# EasyEDA Pro project ESP32S3_DMX_RDM_2026-06-09.epro, board PCB4_1
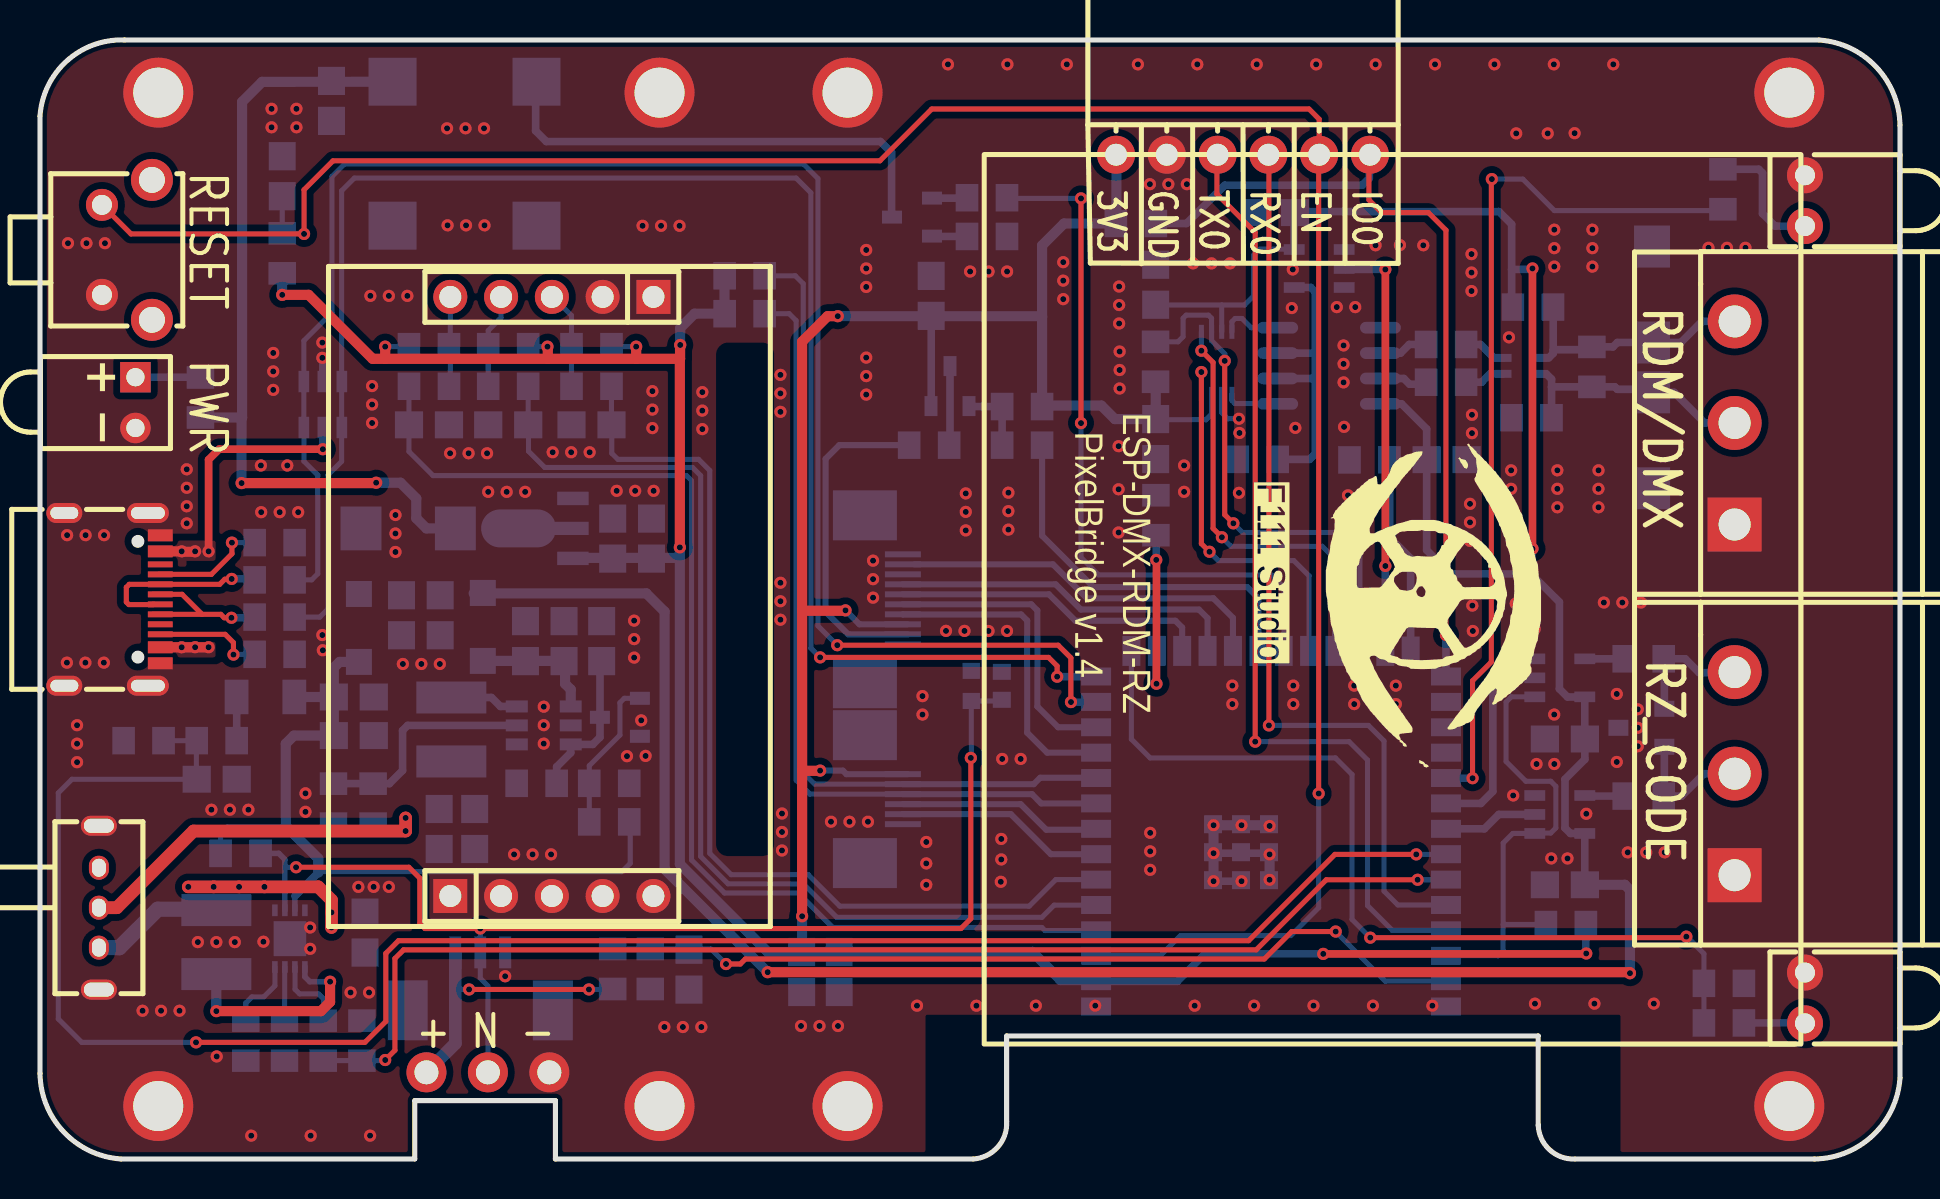
[diagram p11: board, top side]
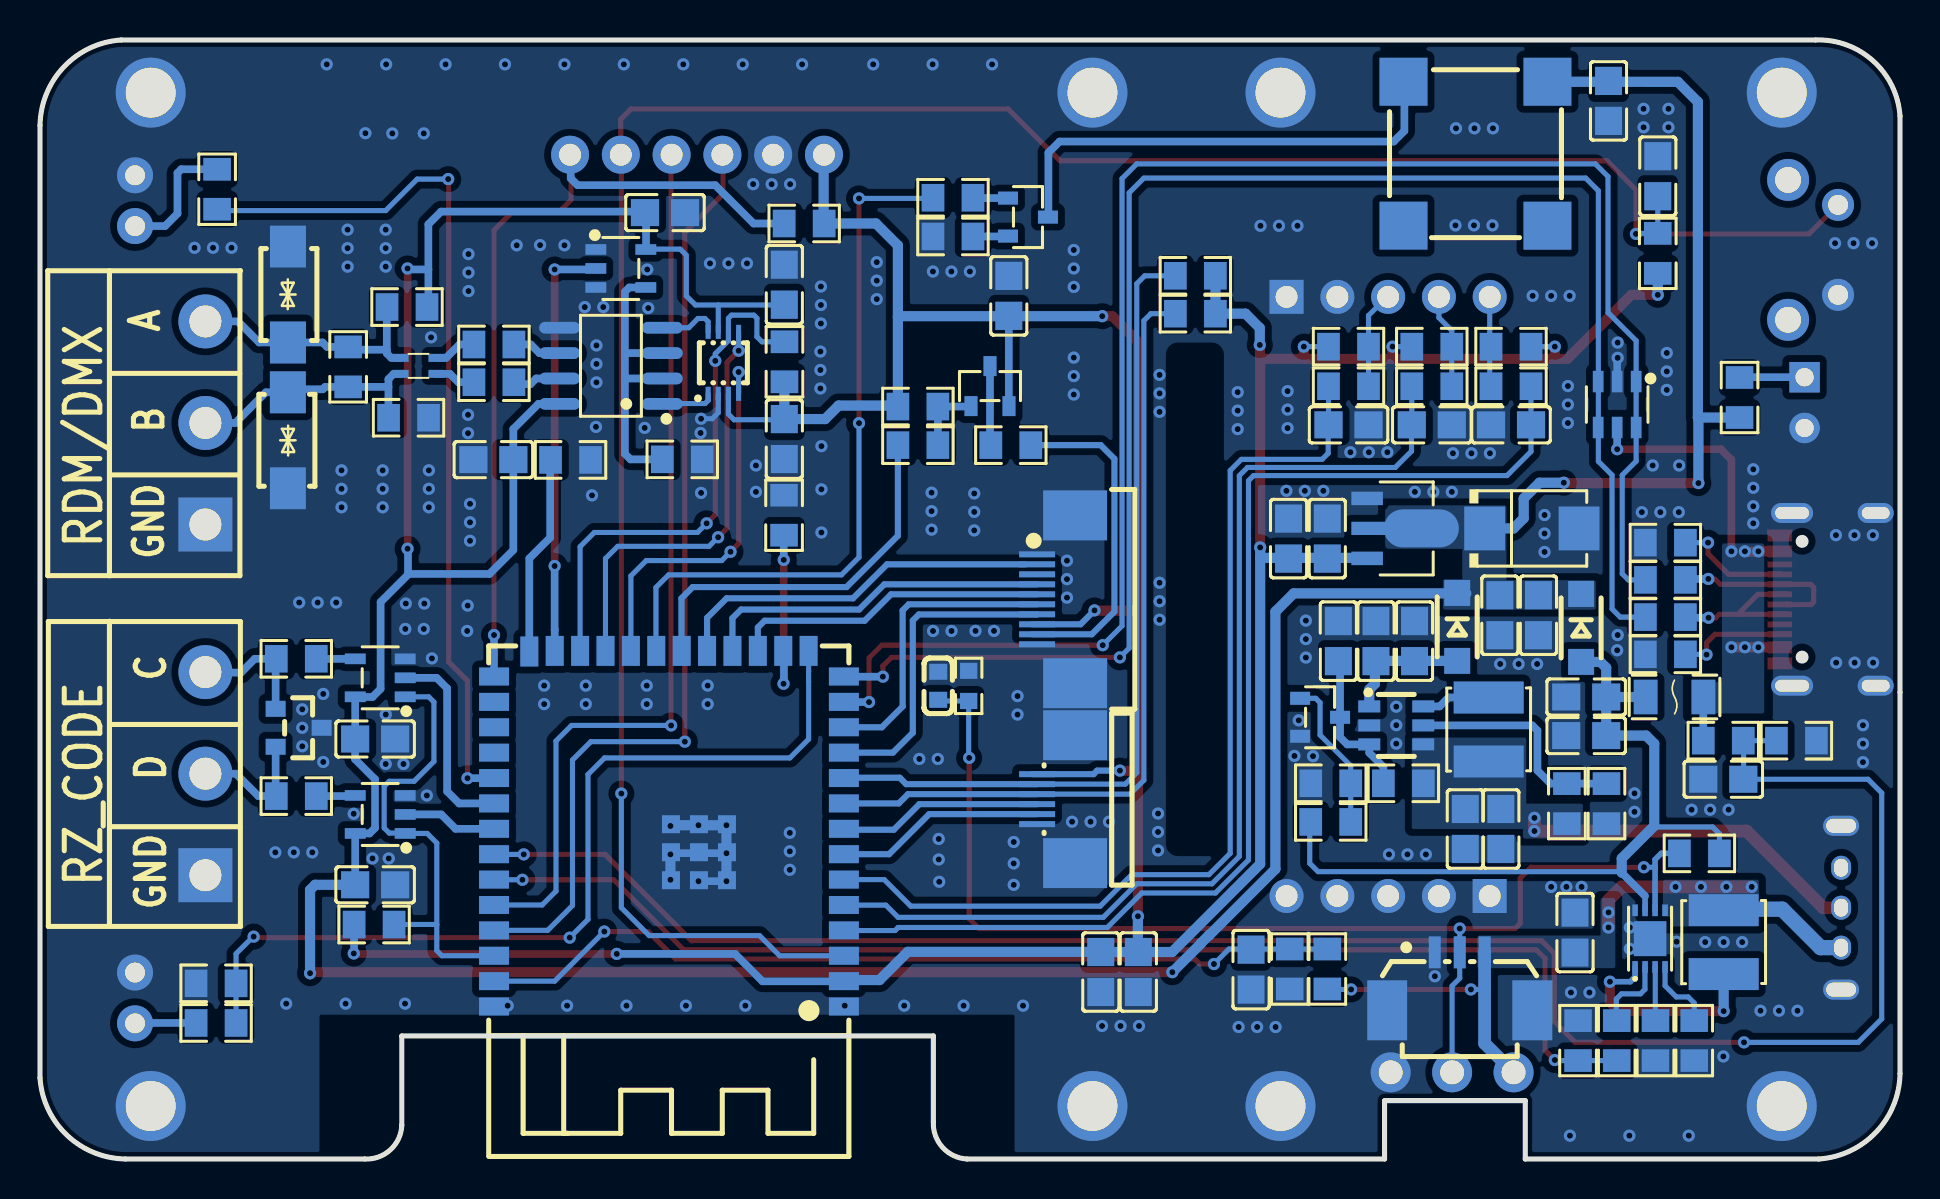
[diagram p12: board, bottom side, seen from below]

Outline 93.03 x 55.98 mm; copper layers: Top Layer, Bottom Layer. Coordinates in mm from the lower left corner of the outline.
Outline path: 0,52.17 0,23.35 0,4.27 arc(1.2,1.34) 4.06,0 18.74,0 18.74,2.92 25.78,2.92 25.78,0 46.66,0 arc(47.89,0.59) 48.35,1.87 48.35,6.16 74.94,6.16 74.94,1.69 arc(75.51,0.46) 76.78,0 88.76,0 arc(91.69,1.2) 93.03,4.06 93.03,51.71 arc(91.84,54.64) 88.97,55.98 4.22,55.98 arc(1.34,54.93) 0,52.17
Stack: Top Layer 0.035mm / Dielectric1 1.51mm FR4 er 4.5 / Bottom Layer 0.035mm

## Design rules (mm)
spacing copperThickness1oz (default): track to track 0.102, other pairs 0.152 to 0.3
spacing copperThickness2oz: track to track 0.203, other pairs 0.152 to 0.3
track width copperThickness1oz (default): min 0.127, default 0.254, max 2.54
track width copperThickness2oz: min 0.203, default 0.254, max 2.54
differential pair differentialPair (default): width min 0.127, default 0.254, max 2.54; gap min 0.152, default 0.152
net GND uses copperRegion1_copperThickness1oz
net VBAT uses copperRegion1_copperThickness2oz, copperThickness2oz
net +5V uses copperRegion1_copperThickness1oz
net VBUS uses copperRegion1_copperThickness1oz
net $2N70 uses copperRegion1_copperThickness1oz

## Placement (name value [footprint] x y rotation side)
C1  100nF  [C0805]  61.77 47.35 0 bottom
C2  100nF  [C0805]  76.27 21.01 0 bottom
C3  100nF  [C0805]  76.27 13.72 0 bottom
C4  100nF  [C0805]  55.8 43.74 90 bottom
C5  100nF  [C0805]  55.8 36.02 90 bottom
C6  100nF  [C0805]  70.36 34.99 180 bottom
C7  10uF  [C0805]  38.1 9.36 90 bottom
C8  100nF  [C0805]  39.98 9.36 90 bottom
C9  100nF  [C0805]  12.12 49.17 270 bottom
C10  100nF  [C0805]  32.46 9.47 90 bottom
C11  22uF  [C0805]  18.08 27.2 90 bottom
C12  100nF  [C0805]  20.02 27.2 90 bottom
C13  22uF  [C0805]  30.58 31.04 270 bottom
C14  100nF  [C0805]  28.65 31.04 270 bottom
C15  22uF  [C0805]  44.58 43.18 270 bottom
C16  100nF  [C0805]  28.09 25.91 270 bottom
C17  10uF  [C0805]  19.96 16.51 270 bottom
C18  22uF  [C0805]  21.74 16.51 270 bottom
C20  22uF  [C0805]  24.28 25.91 90 bottom
C21  22uF  [C0805]  26.21 25.91 90 bottom
C22  100nF  [C0805]  14.58 52.93 90 bottom
C23  10uF  [C0805]  15.7 23.11 0 bottom
C24  100nF  [C0805]  15.7 21.18 180 bottom
C25  10nF  [C0805]  19.46 36.73 180 bottom
C26  10nF  [C0805]  23.42 36.73 0 bottom
C27  10nF  [C0805]  27.58 36.73 0 bottom
C28  10uF  [C0805]  16.26 11.33 90 bottom
C29  100nF  [C0805]  8.84 19 180 bottom
C30  100nF  [C0603]  48.11 23.67 270 bottom
CN1  WJ2EDGRC-5.08-03P-14-00A  [CONN-TH_3P-P5.08_WJ2EDGRC-5.08-3P]  84.76 36.82 90 top
CN2  WJ2EDGRC-5.08-03P-14-00A  [CONN-TH_3P-P5.08_WJ2EDGRC-5.08-3P]  84.76 19.28 90 top
CN3  HCZZ0001-3  [CONN-SMD_3P-P1.25_HCZZ0001-3]  22.02 8.89 180 bottom
D1  PESD5V0S2BT,215  [SOT-23_L2.9-W1.3-P1.90-LS2.4-BR]  80.1 21.57 0 bottom
D2  PMEG2020EH,115  [SOD-123FL_L2.6-W1.6-LS3.4-R-FD]  15.95 26.57 90 bottom
D3  USBLC6-2SC6  [SOT-23-6_L2.9-W1.6-P0.95-LS2.8-BL]  14.15 37.74 0 bottom
D4  PMEG2020EH,115  [SOD-123FL_L2.6-W1.6-LS3.4-R-FD]  22.15 26.62 90 bottom
F1  1206L050/36NR  [F1206]  11.28 23.11 180 bottom
FPC1  05B20L06P  [FPC-SMD_6P-P0.50_05B20L06P]  42.21 18 270 bottom
L1  ACM2012-900-2P-T002  [IND-SMD_4P-L2.0-W1.2-TL]  74.1 39.68 0 bottom
L2  2.2uH  [IND-SMD_L4.0-W4.0]  20.57 21.49 270 bottom
L3  2.2uH  [IND-SMD_L4.0-W4.0]  8.82 10.85 270 bottom
LED1  MHK1375CRBTD  [LED-TH_MHK1375CRBTD]  4.77 37.84 270 top
LED2  MHK1375CGBTD  [LED-TH_MHK1375CGBTD]  88.28 8.06 90 top
LED3  MHK1375CGBTD  [LED-TH_MHK1375CGBTD]  88.28 47.94 90 top
NOREF  -  [Pad_e189]  5.92 53.35 0 top
NOREF#2  -  [Pad_e1365]  30.99 2.65 0 top
NOREF#3  -  [Pad_e192]  87.5 2.65 0 top
NOREF#4  -  [Pad_e193]  87.5 53.35 0 top
NOREF#5  -  [Pad_e188]  5.92 2.65 0 top
NOREF#6  -  [Pad_e191]  40.39 53.35 0 top
NOREF#7  -  [Pad_e1382]  30.99 53.35 0 top
NOREF#8  -  [Pad_e190]  40.39 2.65 0 top
Q1  2N7002  [SOT-23-3_L2.9-W1.3-P1.90-LS2.4-BR]  29.01 22.1 0 bottom
Q2  AO3401A  [SOT-23-3_L2.9-W1.3-P1.90-LS2.4-BR]  45.52 38.67 270 bottom
Q3  S8050  [SOT-23-3_L2.9-W1.3-P1.90-LS2.4-BR]  43.62 47.12 0 bottom
R1  33R  [R0805]  80.22 18.16 180 bottom
R2  10kΩ  [R0805]  55.8 39.88 270 bottom
R3  10kΩ  [R0805]  60.91 35 180 bottom
R4  1kΩ  [R0805]  74.6 37.08 180 bottom
R5  10kΩ  [R0805]  76.32 11.73 0 bottom
R6  0Ω  [R0805]  70.33 38.86 180 bottom
R7  120R  [R0805]  77.62 39.63 270 bottom
R8  33R  [R0805]  80.22 25.02 180 bottom
R9  0Ω  [R0805]  70.33 40.75 180 bottom
R10  1kΩ  [R0805]  74.68 42.62 0 bottom
R11  10kΩ  [R0805]  12.12 45.31 270 bottom
R12  4.7kΩ  [R0805]  8.03 38.09 270 bottom
R13  5.1kΩ  [R0805]  11.73 30.84 0 bottom
R17  10kΩ  [R0805]  54.81 46.8 180 bottom
R18  150kΩ  [R0805]  28.64 9.51 270 bottom
R19  10kΩ  [R0805]  55.82 32.21 270 bottom
R20  10kΩ  [R0805]  66.5 34.97 0 bottom
R21  100kΩ  [R0805]  30.52 9.51 90 bottom
R22  1kΩ  [R0805]  84.23 6.81 180 bottom
R23  1kΩ  [R0805]  84.18 48.51 270 bottom
R24  150kΩ  [R0805]  5.18 20.93 0 bottom
R25  100kΩ  [R0805]  49.12 37.64 0 bottom
R26  100kΩ  [R0805]  28.47 18.8 0 bottom
R27  10kΩ  [R0805]  28.47 16.87 180 bottom
R28  100Ω  [R0805]  49.12 35.71 180 bottom
R29  100kΩ  [R0805]  24.84 18.8 0 bottom
R30  33Ω  [R0805]  44.48 35.71 0 bottom
R31  150kΩ  [R0805]  16.66 17.78 270 bottom
R32  36kΩ  [R0805]  14.68 17.78 90 bottom
R33  4.7kΩ  [R0805]  35.25 44.19 180 bottom
R34  4.7kΩ  [R0805]  35.25 42.29 180 bottom
R35  33kΩ  [R0805]  16.1 5.92 90 bottom
R36  4.7kΩ  [R0805]  19.46 40.64 180 bottom
R37  4.7kΩ  [R0805]  23.42 40.64 0 bottom
R38  4.7kΩ  [R0805]  27.58 40.64 0 bottom
R39  22kΩ  [R0805]  14.17 5.92 270 bottom
R40  100Ω  [R0805]  23.42 38.66 180 bottom
R41  1kΩ  [R0805]  47.37 48.09 180 bottom
R42  100Ω  [R0805]  27.58 38.66 0 bottom
R43  100Ω  [R0805]  19.46 38.66 0 bottom
R44  100Ω  [R0805]  47.37 46.15 180 bottom
R45  0Ω  [R0805]  12.23 5.92 270 bottom
R46  100kΩ  [R0805]  8.84 20.93 0 bottom
R47  10kΩ  [R0805]  10.29 5.92 270 bottom
R48  15kΩ  [R0805]  10.03 15.29 0 bottom
R49  10kΩ  [R0805]  84.23 8.79 180 bottom
R50  0Ω  [R0805]  11.73 28.97 0 bottom
R51  0Ω  [R0805]  11.73 27.11 180 bottom
R52  5.1kΩ  [R0805]  11.73 25.25 0 bottom
R53  SDNT1608X103F3950FTF  [R0603]  46.58 23.67 270 bottom
SW1  KH-6X6X6H-ZJ  [SW-TH_KH-6X6X6H-ZJ-A]  4.35 45.48 270 top
SW2  SK-12D02-G030  [SW-TH_SK-12D02VG3]  2.95 12.57 270 top
TVS1  SMBJ5.0A  [SMB_L4.6-W3.6-LS5.3-RD]  18.42 31.55 180 bottom
U1  SN74AHCT1G125DBVR(UMW)  [SOT-23-5_L3.0-W1.5-P0.95-LS2.8-BL]  63.98 44.55 270 bottom
U2  SN74AHCT1G125DBVR(UMW)  [SOT-23-5_L3.0-W1.5-P0.95-LS2.8-BL]  76.02 17.24 90 bottom
U3  SMAJ12CA  [SMA_L4.3-W2.7-LS5.1-BI]  80.63 35.95 90 bottom
U4  THVD1450DR  [SOIC-8_L4.9-W3.9-P1.27-LS6.0-BL]  64.48 39.68 90 bottom
U5  SN74AHCT1G125DBVR(UMW)  [SOT-23-5_L3.0-W1.5-P0.95-LS2.8-BL]  76.02 24.07 90 bottom
U6  TXS0102DCUR  [VSON8_L2.0-W2.3-P0.50-LS3.1-BL]  58.85 39.83 180 bottom
U7  SMAJ12CA  [SMA_L4.3-W2.7-LS5.1-BI]  80.63 43.25 270 bottom
U8  2.4GHz  [WIRELM-SMD_ESP32-S3-WROOM-1]  61.57 16.52 0 bottom
U9  DS1024-1x6R2  [HDR-TH_6P-P2.54-H-F-W10.0-N]  60.17 50.24 180 top
U10  AP7365-33YRG-13  [SOT-89-3_L4.5-W2.5-P1.50-LS4.2-BR]  25.3 31.55 0 bottom
U11  HC-FPC-0.5-10P-CSH20  [FPC-SMD_10P-P0.50_HC-FPC-0.5-10P-CSH20]  42.21 28 90 bottom
U12  ETA1039S2G  [SOT-23-6_L2.9-W1.6-P0.95-LS2.8-BR]  25.2 21.69 0 bottom
U13  2541WV-05P  [HDR-TH_5P-P2.54-V-M]  25.6 13.16 0 top
U14  2541WV-05P  [HDR-TH_5P-P2.54-V-M]  25.6 43.13 180 top
U15  2.731kHz  [BUZ-SMD_4P-L8.5-W8.5-P8.50-TL-A]  21.23 50.29 270 bottom
U16  SGM41524YTDC8G/TR  [DFN-8_L3.0-W2.0-P0.50-TL-EP-1]  12.5 11.02 90 bottom
U17  GT-USB-7010ASV  [USB-C-SMD_G-SWITCH_GT-USB-7010ASV]  3.62 28 270 top
U19  -  [电池焊盘]  25.48 4.34 0 top
U20  -  [电池焊盘]  19.33 4.34 0 top
U21  -  [电池焊盘]  22.4 4.34 0 top

## Footprints (pads in the part's own frame, mm; a bottom-side part is the same pattern mirrored in y, then rotated)
BUZ-SMD_4P-L8.5-W8.5-P8.50-TL-A
  rect 2.4x2.4 smd: 1(-3.6,3.6) 2(-3.6,-3.6) 3(3.599,-3.599) 4(3.6,3.6)
C0603
  rect 0.8x0.9 smd: 1(-0.7,0) 2(0.7,0)
C0805
  rect 1.41x1.35 smd: 1(-1,0) 2(1,0)
CONN-SMD_3P-P1.25_HCZZ0001-3
  rect 0.6x1.6 smd: 1(-1.25,1.45) 2(0,1.45) 3(1.25,1.45)
  rect 2x3 smd: 4(3.63,-1.45) 5(-3.63,-1.45)
CONN-TH_3P-P5.08_WJ2EDGRC-5.08-3P
  rect 2.7x2.7 hole 1.6: 1(-5.08,0)
  round 2.7 hole 1.6: 2(0,0) 3(5.08,0)
DFN-8_L3.0-W2.0-P0.50-TL-EP-1
  rect 0.585x0.28 smd: 1(-1.417,0.75) 2(-1.417,0.25) 3(-1.417,-0.25) 4(-1.417,-0.75) 5(1.417,-0.75) 6(1.417,-0.25) 7(1.417,0.25) 8(1.417,0.75)
  rect 1.75x1.63 smd: 9(0,0)
F1206
  rect 1.19x1.728 smd: 1(-1.445,0) 2(1.445,0)
FPC-SMD_6P-P0.50_05B20L06P
  rect 0.3x1.8 smd: 1(-1.25,-0.95) 2(-0.75,-0.95) 3(-0.25,-0.95) 4(0.25,-0.95) 5(0.75,-0.95) 6(1.25,-0.95)
  rect 2.5x3.2 smd: 7(-3.2,0.95) 8(3.2,0.95)
FPC-SMD_10P-P0.50_HC-FPC-0.5-10P-CSH20
  rect 0.3x1.8 smd: 1(2.25,0.95) 2(1.75,0.95) 3(1.25,0.95) 4(0.75,0.95) 5(0.25,0.95) 6(-0.25,0.95) 7(-0.75,0.95) 8(-1.25,0.95) 9(-1.75,0.95) 10(-2.25,0.95)
  rect 2.5x3.2 smd: 11(-4.2,-0.95) 12(4.2,-0.95)
HDR-TH_5P-P2.54-V-M
  rect 1.7x1.7 hole 1.1: 1(-5.08,0)
  round 1.7 hole 1.1: 2(-2.54,0) 3(0,0) 4(2.54,0) 5(5.08,0)
HDR-TH_6P-P2.54-H-F-W10.0-N
  round 1.9 hole 1.1: 1(-6.35,0) 2(-3.81,0) 3(-1.27,0) 4(1.27,0) 5(3.81,0) 6(6.35,0)
IND-SMD_4P-L2.0-W1.2-TL
  rect 0.8x0.4 smd: 1(-0.901,0.399) 2(-0.899,-0.4) 3(0.9,-0.401) 4(0.901,0.401)
IND-SMD_L4.0-W4.0
  rect 1.6x3.5 smd: 1(-1.6,0) 2(1.6,0)
LED-TH_MHK1375CGBTD
  round 1.8 hole 1: 1(-1.27,0) 2(1.27,0)
LED-TH_MHK1375CRBTD
  rect 1.524x1.524 hole 0.914: 1(-1.27,0)
  round 1.524 hole 0.914: 2(1.27,0)
Pad_e188
  round 3.5 hole 2.5: 1(0,0)
Pad_e189
  round 3.5 hole 2.5: 1(0,0)
Pad_e190
  round 3.5 hole 2.5: 1(0,0)
Pad_e191
  round 3.5 hole 2.5: 1(0,0)
Pad_e192
  round 3.5 hole 2.5: 1(0,0)
Pad_e193
  round 3.5 hole 2.5: 1(0,0)
Pad_e1365
  round 3.5 hole 2.5: 1(0,0)
Pad_e1382
  round 3.5 hole 2.5: 1(0,0)
R0603
  rect 0.806x0.864 smd: 1(-0.753,0) 2(0.753,0)
R0805
  rect 1.133x1.377 smd: 1(-1,0) 2(1,0)
SMA_L4.3-W2.7-LS5.1-BI
  rect 2.1x1.8 smd: 1(-2.4,0) 2(2.4,0)
SMB_L4.6-W3.6-LS5.3-RD
  rect 2.047x2.192 smd: 1(-2.361,0) 2(2.361,0)
SOD-123FL_L2.6-W1.6-LS3.4-R-FD
  rect 1.3x1.3 smd: 1(1.7,0) 2(-1.7,0)
SOIC-8_L4.9-W3.9-P1.27-LS6.0-BL
  oval 0.588x2.045 smd: 1(-1.905,-2.57) 2(-0.635,-2.57) 3(0.635,-2.57) 4(1.905,-2.57) 5(1.905,2.57) 6(0.635,2.57) 7(-0.635,2.57) 8(-1.905,2.57)
SOT-23-3_L2.9-W1.3-P1.90-LS2.4-BR
  rect 1x0.65 smd: 1(1,-0.95) 2(1,0.95) 3(-1,0)
SOT-23-5_L3.0-W1.5-P0.95-LS2.8-BL
  rect 0.532x1.045 smd: 1(-0.95,-1.25) 2(0,-1.25) 3(0.95,-1.25) 4(0.95,1.25) 5(-0.95,1.25)
SOT-23-6_L2.9-W1.6-P0.95-LS2.8-BL
  rect 0.532x1.072 smd: 1(-0.95,-1.149) 2(0,-1.149) 3(0.95,-1.149) 4(0.95,1.149) 5(0,1.149) 6(-0.95,1.149)
SOT-23-6_L2.9-W1.6-P0.95-LS2.8-BR
  rect 1.1x0.6 smd: 1(1.35,-0.95) 2(1.35,0) 3(1.35,0.95) 4(-1.35,0.95) 5(-1.35,0) 6(-1.35,-0.95)
SOT-23_L2.9-W1.3-P1.90-LS2.4-BR
  rect 1x0.8 smd: 1(1.15,-0.95) 2(1.15,0.95) 3(-1.15,0)
SOT-89-3_L4.5-W2.5-P1.50-LS4.2-BR
  rect 1.575x0.672 smd: 1(1.356,-1.5) 3(1.356,1.5)
  custom 5.377x1.9 smd: 2(-1.356,0)
SW-TH_KH-6X6X6H-ZJ-A
  round 1.6 hole 1: 1(-2.25,-1.25) 2(2.25,-1.25)
  round 2.1 hole 1.3: 3(-3.5,1.25) 4(3.5,1.25)
SW-TH_SK-12D02VG3
  oval 1.2x1 hole 0.9x0.7: 1(-1.998,0) 2(0.001,0) 3(1.999,0)
  oval 1x1.8 hole 0.7x1.5: 4(4.099,0) 5(-4.099,0)
USB-C-SMD_G-SWITCH_GT-USB-7010ASV
  oval 1x2.1 hole 0.6x1.7: 1(-4.32,1.78) 2(4.32,1.78)
  oval 1x1.8 hole 0.6x1.4: 3(4.32,-2.4) 4(-4.32,-2.4)
  rect 0.6x1.24 smd: A1B12(-3.2,2.4) A4B9(-2.4,2.4) B1A12(3.2,2.4) B4A9(2.4,2.4)
  rect 0.3x1.24 smd: A5(-1.25,2.4) A6(-0.25,2.4) A7(0.25,2.4) A8(1.25,2.4) B5(1.75,2.4) B6(0.75,2.4) B7(-0.75,2.4) B8(-1.75,2.4)
VSON8_L2.0-W2.3-P0.50-LS3.1-BL
  rect 0.25x0.7 smd: 1(-0.762,-1.55) 2(-0.254,-1.55) 3(0.254,-1.55) 4(0.762,-1.55) 5(0.762,1.55) 6(0.254,1.55) 7(-0.254,1.55) 8(-0.762,1.55)
WIRELM-SMD_ESP32-S3-WROOM-1
  rect 1.5x0.9 smd: 1(-8.75,8.895) 2(-8.75,7.625) 3(-8.75,6.355) 4(-8.75,5.085) 5(-8.75,3.815) 6(-8.75,2.545) 7(-8.75,1.275) 8(-8.75,0.005) 9(-8.75,-1.265) 10(-8.75,-2.535) 11(-8.75,-3.805) 12(-8.75,-5.075) 13(-8.75,-6.345) 14(-8.75,-7.615) 27(8.75,-7.615) 28(8.75,-6.345) 29(8.75,-5.075) 30(8.75,-3.805) 31(8.75,-2.535) 32(8.75,-1.265) 33(8.75,0.005) 34(8.75,1.275) 35(8.75,2.545) 36(8.75,3.815) 37(8.75,5.085) 38(8.75,6.355) 39(8.75,7.625) 40(8.75,8.895)
  rect 0.9x1.5 smd: 15(-6.985,-8.895) 16(-5.715,-8.895) 17(-4.445,-8.895) 18(-3.175,-8.895) 19(-1.905,-8.895) 20(-0.635,-8.895) 21(0.635,-8.895) 22(1.905,-8.895) 23(3.175,-8.895) 24(4.445,-8.895) 25(5.715,-8.895) 26(6.985,-8.865)
  rect 0.9x0.9 smd: 41(-2.9,-0.225) 41(-2.9,1.175) 41(-2.9,2.575) 41(-1.5,-0.225) 41(-1.5,1.175) 41(-1.5,2.575) 41(-0.1,-0.225) 41(-0.1,1.175) 41(-0.1,2.575)
电池焊盘
  round 2 hole 1.2: 1(0,0)

## Nets
+3.3V: C5.2 C7.2 C8.2 C13.2 C14.2 C15.2 FPC1.1 Q2.2 R2.2 R5.2 R11.2 R17.2 R25.2 R33.2 R34.2 R36.2 R37.2 R38.2 U6.3 U8.2 U9.6 U10.3 U11.8
+5V: C1.2 C2.2 C3.2 C4.1 C6.2 C11.2 C12.2 C22.2 D2.1 D4.1 R10.1 R12.2 TVS1.1 U1.5 U2.5 U4.8 U5.5 U6.7 U10.2 U15.1
GND: C1.1 C2.1 C3.1 C4.2 C5.1 C6.1 C7.1 C8.1 C9.1 C10.1 C11.1 C12.1 C13.1 C14.1 C15.1 C16.1 C17.2 C18.2 C20.2 C21.2 C22.1 C23.2 C24.1 C25.1 C26.1 C27.1 C28.2 C29.1 C30.1 CN1.1 CN2.1 CN3.1 CN3.4 CN3.5 D1.3 D3.2 FPC1.6 FPC1.7 FPC1.8 LED1.2 LED2.2 LED3.2 NOREF.1 NOREF#2.1 NOREF#3.1 NOREF#4.1 NOREF#5.1 NOREF#6.1 NOREF#7.1 NOREF#8.1 Q1.2 R3.2 R4.2 R13.2 R19.1 R20.1 R21.1 R24.1 R26.2 R32.1 R35.2 R44.1 R45.2 R47.2 R49.1 R52.2 R53.1 SW1.2 SW2.4 SW2.5 TVS1.2 U1.1 U1.3 U2.3 U3.1 U4.5 U5.3 U6.2 U7.1 U8.1 U8.40 U8.41 U9.5 U10.1 U11.1 U11.10 U11.11 U11.12 U12.2 U13.1 U13.2 U13.3 U13.4 U13.5 U14.1 U14.2 U16.8 U16.9 U17.1 U17.2 U17.3 U17.4 U17.A1B12 U17.B1A12 U19.1
VBAT: C28.1 CN3.3 L3.1 R18.2 SW2.3 U16.5 U20.1
VBUS: D3.5 F1.2 R46.2 U17.A4B9 U17.B4A9
A: R37.1 R40.2 U14.4
B: R36.1 R43.2 U14.5
BAT_ADC: C10.2 R18.1 R21.2 U8.39
BEEP: R41.1 U8.21
CHARGING: R35.1 R39.2 U8.35
CTP_INT: FPC1.4 U8.8
CTP_RST: FPC1.5 U8.7
CTP_SCL: FPC1.3 R34.1 U8.9
CTP_SDA: FPC1.2 R33.1 U8.10
DMX_EN: U1.2 U8.25
DMX_OE: R2.1 U6.6 U8.24
DMX_RX: U6.4 U8.22
DMX_TX: U6.5 U8.23
DN: R50.1 U17.A7 U17.B7
DP: R51.2 U17.A6 U17.B6
EN: C9.2 R11.1 SW1.1 U8.3 U9.2
ENCODER_A: C26.2 R40.1 U8.5
ENCODER_B: C25.2 R43.1 U8.4
ENCODER_KEY: C27.2 R42.2 U8.6
IO0: R17.1 U8.27 U9.1
KEY: R38.1 R42.1 U14.3
LCD_A: R30.1 U11.9
LCD_BL: R28.1 U8.20
LCD_CS: U8.17 U11.5
LCD_RS: U8.11 U11.7
LCD_RST: U8.12 U11.6
LCD_SCL: U8.18 U11.4
LCD_SDA: U8.19 U11.2
LED2: R22.2 R49.2 U8.15
LED3: R23.2 U8.31
RXD0: U8.36 U9.3
RZ_CLK: U5.2 U8.32
RZ_DATA: U2.2 U8.33
RZ_OE: R5.1 U2.1 U5.1 U8.38
TXD0: U8.37 U9.4
USB_DET: C29.2 R24.2 R46.1 U8.34
USB_DN: D3.1 D3.6 R50.2 U8.13
USB_DP: D3.3 D3.4 R51.1 U8.14
VCHAR: C23.1 C24.2 D2.2 F1.1 R27.1 R48.1 U16.7
$1N61: CN1.3 L1.3 R7.1 R10.2 U7.2
$1N69: R3.1 U1.4 U4.2 U4.3
$1N71: CN1.2 L1.4 R4.1 R7.2 U3.2
$1N81: R1.2 U2.4
$1N82: R8.2 U5.4
$1N83: CN2.2 D1.2 R1.1
$1N88: U4.1 U6.1
$1N92: U4.4 U6.8
$1N94: CN2.3 D1.1 R8.1
$1N98: R6.2 U4.7
$1N99: R9.2 U4.6
$1N105: LED1.1 R12.1
$1N108: L1.1 R6.1
$1N109: L1.2 R9.1
$1N111: LED2.1 R22.1
$1N113: LED3.1 R23.1
$1N120: R20.2 U8.26
$1N121: R19.2 U8.16
$1N139: R52.1 U17.B5
$1N140: R13.1 U17.A5
$2N5: Q3.3 U15.2
$2N7: Q3.2 R44.2
$2N9: Q3.1 R41.2
$2N39: U11.3
$2N53: Q2.3 R30.2
$2N57: Q2.1 R25.1 R28.2
$2N64: R31.1 R32.2 U12.5
$2N65: L2.1 U12.6
$2N66: C16.2 Q1.3 R29.2 U12.3
$2N67: C20.1 C21.1 D4.2 U12.1
$2N70: C17.1 C18.1 L2.2 R29.1 R31.2 SW2.2 U12.4
$2N73: R47.1 U16.4
$2N76: R45.1 U16.3
$2N77: L3.2 U16.1
$2N79: C30.2 CN3.2 R48.2 R53.2 U16.6 U21.1
$2N87: Q1.1 R26.1 R27.2
$2N101: R39.1 U16.2

Pads without a net: SW1 3 4; SW2 1; U8 28 29 30; U15 3 4; U17 A8 B8

## Via types
v1: diameter 0.61, hole 0.305, Top Layer to Bottom Layer, 366 vias

## Routing (per net, layer and track width the routed paths; a pad name or vN(x,y) marks a point on that pad's centre or on a via; arc(x,y) is an arc through that point)
+3.3V: length 199.8
  Top Layer w0.381: v1(64.19,10.26) 77.32,10.26 v1(77.34,10.28)
  Top Layer w0.508: 32.01,40.03 32.01,40.72 v1(32.02,40.72) ; 32.01,40.03 32,40.02 v1(32,30.6) ; 32.01,40.03 29.82,40.03 ; v1(25.38,40.64) 25.4,40.62 25.4,40.03 ; v1(38.12,12.14) 38.12,19.42 ; 38.12,19.42 38.12,27.43 ; 38.12,19.42 39.01,19.42 v1(39.02,19.43) ; 17.27,40.03 v1(17.27,40.64) ; 17.27,40.03 25.4,40.03 ; 17.27,40.03 16.64,40.03 13.44,43.23 v1(12.12,43.23) ; 25.4,40.03 29.82,40.03 ; 29.82,40.03 v1(29.82,40.64) ; 38.12,27.43 40.27,27.43 v1(40.29,27.45) ; 38.12,27.43 38.12,40.89 39.4,42.16 v1(39.9,42.16)
  Bottom Layer w0.254: C5.2 55.84,36.98 58.32,36.98 58.6,37.26 U6.3 ; R38.2 v1(29.82,40.64) ; R37.2 v1(25.38,40.64) ; R36.2 v1(17.27,40.64)
  Bottom Layer w0.305: 43.39,19.25 40.34,19.25 40.16,19.43 v1(39.02,19.43) ; v1(40.29,27.45) 40.99,26.75 43.39,26.75
  Bottom Layer w0.381: Q2.2 44.58,37.68 C15.2 ; v1(64.19,10.26) 58.27,10.26 56.9,8.89 52.83,8.89 ; v1(77.34,10.28) 77.32,10.3 R5.2
  Bottom Layer w0.508: v1(39.9,42.16) 50.09,42.16 50.12,42.13 ; U9.6 53.84,50.22 53.84,46.83 R17.2 51.22,46.8 50.12,45.7 50.12,42.13 ; C7.2 38.12,10.38 v1(38.12,12.14) ; C7.2 C8.2 39.98,10.36 49.63,10.36 51.04,8.95 52.77,8.95 U8.2 ; C7.2 36.41,10.36 32,14.76 32,30.07 26.68,30.07 U10.3 ; 50.12,42.13 R25.2 50.17,37.69 53.09,37.69 53.76,37.02 C5.2 55.8,38.88 R2.2 ; v1(32.02,40.72) 32.02,41.57 32.74,42.29 34.24,42.29 34.24,44.19 ; v1(32,30.6) 32,30.12 ; R11.2 v1(12.12,43.23)
+5V: length 198.7
  Top Layer w0.381: v1(74.65,30.53) v1(74.65,44.55)
  Top Layer w0.508: v1(16.81,33.83) 16.8,33.81 v1(10.08,33.81) ; v1(79.53,9.3) 79.48,9.35 v1(36.4,9.35)
  Bottom Layer w0.254: 59.11,42.72 56.3,42.72 56.25,42.77 55.84,42.77 C4.1 ; 59.11,42.72 60.25,42.72 60.71,43.18 60.71,45.21 61.01,45.52 62.72,45.52 ; 59.11,42.72 U6.7 ; 62.72,45.52 U1.5
  Bottom Layer w0.381: C1.2 62.82,47.4 72.97,47.4 73.61,46.76 73.61,44.5 ; 62.7,47.35 62.7,47.02 62.72,47 62.72,45.52 ; 73.61,44.5 73.61,42.67 73.62,42.67 R10.1 ; 73.61,44.5 74.6,44.5 v1(74.65,44.55) ; 74.63,29.27 70.55,29.27 69.36,30.46 C6.2 69.36,36.52 68.1,37.78 U4.8 ; 74.63,29.27 74.63,29.23 76,27.86 76,23.52 76.4,23.11 77.26,23.11 U5.5 77.27,21.02 C2.2 77.27,20 76.28,19 76.28,16.56 76.55,16.29 U2.5 77.27,13.72 76.97,13.72 ; 74.63,29.27 74.63,30.51 v1(74.65,30.53)
  Bottom Layer w0.508: TVS1.1 19.33,31.55 18.82,32.06 18.82,33.05 18.03,33.83 v1(16.81,33.83) ; 10.11,37.09 10.11,52.88 11.11,53.89 U15.1 ; 10.11,37.09 10.08,37.07 v1(10.08,33.81) ; 10.11,37.09 R12.2 ; C3.2 79.27,13.72 79.53,13.46 79.53,9.25 ; 21.69,28.3 30.33,28.3 31.24,27.38 31.24,14.5 34.54,11.2 34.56,11.2 34.98,10.79 34.98,10.77 v1(36.4,9.35)
GND: length 14.2
  Bottom Layer w0.254: v1(59.97,37.03) 59.41,37.03 59.11,37.34 U6.2
  Bottom Layer w0.381: v1(58.7,15.3) 61.44,15.3 v1(61.5,15.24) ; v1(14.12,40.08) 14.15,40.06 D3.2 ; v1(58.7,13.9) v1(60.1,13.9)
  Bottom Layer w0.508: v1(58.7,13.9) v1(58.7,15.3) v1(58.7,16.7) v1(60.1,16.7) 61.5,16.7 ; v1(61.5,15.24) v1(61.5,13.97)
  vias: v1(1.35,24.83) v1(1.4,45.81) v1(1.36,31.21) v1(1.85,21.7) v1(1.85,20.78) v1(1.85,19.85) v1(2.33,45.81) v1(2.28,31.21) v1(2.27,24.83) v1(3.25,45.81) v1(3.21,31.21) v1(3.19,24.83) v1(5.13,7.42) v1(6.06,7.42) v1(6.98,7.42) v1(7.34,34.5) v1(7.34,33.58) v1(7.34,32.65) v1(7.34,31.8) v1(7.9,10.85) v1(8.58,17.47) v1(8.82,10.85) v1(8.84,5.13) v1(9.5,17.47) v1(9.75,10.85) v1(10.42,17.47) v1(10.57,1.17) v1(11.05,34.7) v1(11.06,32.36) v1(11.18,10.87) v1(11.58,52.54) v1(11.58,51.61) v1(11.67,40.33) v1(11.67,39.4) v1(11.67,38.48) v1(11.99,32.36) v1(12.37,34.7) v1(12.83,52.54) v1(12.83,51.61) v1(12.91,32.36) v1(13.28,18.29) v1(13.28,17.37) v1(13.51,11.58) v1(13.51,10.52) v1(13.54,1.17) v1(14.12,40.84) v1(14.12,26.21) v1(14.15,25.45) v1(15.53,8.33) v1(15.93,13.61) v1(16.53,43.18) v1(16.46,8.33) v1(16.51,1.17) v1(16.61,38.67) v1(16.61,37.74) v1(16.61,36.82) v1(16.69,13.61) v1(17.45,43.18) v1(17.45,13.61) v1(17.78,32.22) v1(17.78,31.29) v1(17.78,30.37) v1(18.15,24.77) v1(18.37,43.18) v1(19.08,24.77) v1(20,24.77) v1(20.36,51.56) v1(20.39,46.71) v1(20.51,35.31) v1(21.28,51.56) v1(21.31,46.71) v1(21.44,35.31) v1(22.21,51.56) v1(22.23,46.71) v1(22.36,35.31) v1(22.42,33.38) v1(23.34,33.38) v1(23.27,9.14) v1(23.71,15.24) v1(24.27,33.38) v1(24.64,15.24) v1(25.2,22.63) v1(25.2,21.7) v1(25.2,20.78) v1(25.64,35.36) v1(25.56,15.24) v1(26.57,35.36) v1(27.49,35.36) v1(28.84,33.43) v1(29.36,20.15) v1(29.72,26.93) v1(29.72,26.01) v1(29.72,25.08) v1(29.77,33.43) v1(30.14,46.69) v1(30.07,21.95) v1(30.29,20.17) v1(30.63,38.42) v1(30.63,37.49) v1(30.63,36.57) v1(30.69,33.43) v1(31.06,46.69) v1(31.23,6.6) v1(31.99,46.69) v1(32.16,6.6) v1(33.13,38.36) v1(33.13,37.44) v1(33.13,36.52) v1(33.08,6.6) v1(37.04,39.23) v1(37.04,38.3) v1(37.04,37.38) v1(37.04,28.83) v1(37.04,27.9) v1(37.04,26.98) v1(37.11,17.28) v1(37.11,16.36) v1(37.11,15.44) v1(38.06,6.66) v1(38.99,6.66) v1(39.56,16.87) v1(39.91,6.66) v1(40.49,16.87) v1(41.33,45.48) v1(41.33,44.55) v1(41.33,43.63) v1(41.33,40.09) v1(41.33,39.17) v1(41.33,38.24) v1(41.41,16.87) v1(41.67,29.93) v1(41.67,29.01) v1(41.67,28.08) v1(43.87,7.67) v1(44.14,23.16) v1(44.14,22.23) v1(44.33,15.86) v1(44.33,14.79) v1(44.33,13.72) v1(45.32,26.42) v1(45.41,54.76) v1(46.24,26.42) v1(46.31,33.3) v1(46.31,32.37) v1(46.31,31.45) v1(46.52,44.4) v1(46.84,7.67) v1(47.45,44.4) v1(47.44,26.42) v1(48.13,20.02) v1(48.08,16.01) v1(48.08,14.99) v1(48.06,13.87) v1(48.39,54.76) v1(48.37,44.4) v1(48.44,33.33) v1(48.44,32.41) v1(48.44,31.49) v1(48.37,26.42) v1(49.05,20.02) v1(49.81,7.67) v1(51.18,44.87) v1(51.18,43.94) v1(51.18,43.02) v1(51.36,54.76) v1(52.78,7.67) v1(53.95,35.66) v1(53.95,33.5) v1(53.95,31.34) v1(53.97,43.65) v1(53.97,42.72) v1(53.97,41.8) v1(54,40.4) v1(54,39.47) v1(54,38.55) v1(54.91,54.76) v1(55.51,48.77) v1(55.53,16.32) v1(55.53,15.39) v1(55.53,14.47) v1(56.44,48.77) v1(57.23,34.7) v1(57.23,33.38) v1(57.36,48.77) v1(57.67,44.81) v1(57.75,7.67) v1(57.89,54.76) v1(58.6,44.81) v1(59.52,44.81) v1(59.64,23.68) v1(59.64,22.76) v1(60,36.32) v1(59.97,33.33) v1(60.73,7.67) v1(60.86,54.76) v1(61.5,16.66) v1(62.61,42.57) v1(62.66,44.5) v1(62.69,23.68) v1(62.69,22.76) v1(62.79,36.58) v1(63.7,7.67) v1(63.83,54.76) v1(64.86,42.62) v1(65.2,40.7) v1(65.2,39.78) v1(65.2,38.85) v1(65.23,36.63) v1(65.43,33.2) v1(65.74,23.68) v1(65.74,22.76) v1(65.79,42.62) v1(66.67,7.67) v1(66.8,54.76) v1(66.8,45.71) v1(67.82,23.68) v1(67.82,22.76) v1(68.02,45.72) v1(69.19,45.71) v1(69.64,7.67) v1(69.78,54.76) v1(71.53,32.78) v1(71.53,31.85) v1(71.53,30.93) v1(71.6,45.27) v1(71.6,44.35) v1(71.6,43.42) v1(71.62,37.23) v1(71.62,36.31) v1(71.64,27.69) v1(71.67,26.42) v1(72.75,54.76) v1(73.43,25.04) v1(73.47,41.11) v1(73.58,34.45) v1(73.58,33.53) v1(73.58,32.6) v1(73.69,18.19) v1(73.84,51.31) v1(73.81,27.79) v1(73.84,26.52) v1(74.74,27.79) v1(74.76,26.52) v1(74.78,7.77) v1(74.85,19.76) v1(75.41,51.31) v1(75.59,15.04) v1(75.72,54.76) v1(75.74,46.49) v1(75.74,45.57) v1(75.74,44.64) v1(75.74,22.24) v1(75.74,19.76) v1(75.9,34.45) v1(75.9,33.53) v1(75.9,32.6) v1(76.4,15.04) v1(76.76,51.32) v1(77.34,17.27) v1(77.65,46.49) v1(77.65,45.57) v1(77.65,44.64) v1(77.75,7.77) v1(77.95,34.45) v1(77.95,33.53) v1(77.95,32.6) v1(78.22,27.84) v1(78.69,54.76) v1(78.87,23.27) v1(78.87,19.86) v1(79.15,27.84) v1(79.42,15.34) v1(79.92,22.5) v1(79.92,21.57) v1(79.92,20.65) v1(80.07,27.84) v1(80.34,15.34) v1(80.72,7.77) v1(81.26,15.34) v1(83.46,45.58) v1(84.38,45.58) v1(85.3,45.58)
VBAT: length 31.2
  Top Layer w0.254: v1(21.46,8.48) v1(27.46,8.48)
  Top Layer w0.635: v1(7.42,13.61) v1(8.69,13.61) v1(9.96,13.61) v1(11.23,13.61) 13.92,13.61 14.58,12.95 v1(14.58,12.34) v1(14.58,11.58)
  Bottom Layer w0.254: 20.78,8.48 v1(21.46,8.48) ; R18.2 28.62,8.48 v1(27.46,8.48)
  Bottom Layer w0.635: CN3.3 20.78,10.33 20.78,5.78 U20.1
  Bottom Layer w0.762: 8.78,12.5 L3.1 ; 8.78,12.5 5.89,12.5 3.97,10.57 SW2.3 ; 8.78,12.5 10.05,12.5
VBUS: length 18.6
  Top Layer w0.381: v1(14.15,35.51) 8.96,35.51 8.43,34.98 v1(8.43,30.4)
  Top Layer w0.508: 5.67,30.4 v1(7.09,30.4) 7.11,30.38 7.71,30.38 7.76,30.43 ; v1(8.43,25.6) 8.43,25.6 v1(7.09,25.6) 5.67,25.6
  Bottom Layer w0.381: R46.2 9.84,23.06 9.83,23.06 ; D3.5 v1(14.15,35.51)
  vias: v1(7.76,30.4) v1(7.76,25.6)
A: length 4.7
  Bottom Layer w0.254: 23.06,43.13 23.06,42.09 22.42,41.44 R37.1 R40.2
B: length 4.4
  Bottom Layer w0.254: U14.5 20.52,38.72
  Bottom Layer w0.381: 20.55,38.7 20.56,38.68
BAT_ADC: length 43.7
  Top Layer w0.254: v1(34.32,9.75) 35.03,9.75 35.28,10.01 61.24,10.01 62.61,11.38 v1(64.81,11.38)
  Bottom Layer w0.254: 34.31,9.75 33.56,10.51 R21.2 R18.1 ; v1(64.81,11.38) 67.29,8.9 U8.39
BEEP: length 35.6
  Top Layer w0.254: v1(52.07,36.81) v1(52.07,48.06)
  Bottom Layer w0.254: U8.21 62.22,25.44 62.22,28.59 61.59,29.22 52.95,29.22 52.07,30.1 v1(52.07,36.81) ; R41.1 48.4,48.06 v1(52.07,48.06)
CHARGING: length 62.6
  Top Layer w0.254: v1(17.27,4.95) 17.75,5.44 17.75,10.03 18.19,10.47 60.83,10.47 64.34,13.97 v1(68.91,13.97)
  Bottom Layer w0.254: v1(17.27,4.95) 17.24,4.92 R35.1 14.19,4.92 ; v1(68.91,13.97) 70.33,13.97 U8.35
CTP_INT: length 10.2
  Bottom Layer w0.305: FPC1.4 49.05,17.75 50.33,16.47 52.78,16.47 U8.8
CTP_RST: length 10.5
  Bottom Layer w0.305: FPC1.5 48.56,17.25 50.56,15.25 U8.7
CTP_SCL: length 40.2
  Bottom Layer w0.254: R34.1 37.47,42.29 37.82,41.94 37.82,18.95 38.52,18.25 FPC1.3
  Bottom Layer w0.305: FPC1.3 49.62,18.25 50.08,17.79 U8.9
CTP_SDA: length 41.6
  Bottom Layer w0.254: FPC1.2 38.75,18.75 38.18,19.33 38.18,43.79 37.78,44.19 R33.1
  Bottom Layer w0.305: FPC1.2 49.71,18.75 50.03,19.07 52.81,19.07 U8.10
DMX_EN: length 21.2
  Top Layer w0.381: v1(67.29,29.67) v1(67.29,44.5)
  Bottom Layer w0.381: v1(67.29,29.67) 67.29,26.49 67.29,26.48 67.29,25.42 ; v1(67.29,44.5) 65.28,44.5 U1.2
DMX_OE: length 26.7
  Top Layer w0.254: v1(59.69,31.8) 59.26,32.23 v1(59.26,39.93)
  Bottom Layer w0.254: v1(59.26,39.93) 59.26,40.28 58.6,40.94 U6.6 58.6,42.06 58.45,42.22 57.33,42.22 57.18,42.06 57.18,41.14 56.92,40.88 R2.1 ; U8.24 66.02,30.63 65.31,31.34 60.15,31.34 v1(59.69,31.8)
DMX_RX: length 19.5
  Top Layer w0.254: v1(58.09,39.37) 58.09,30.78 v1(58.5,30.38)
  Bottom Layer w0.254: v1(58.5,30.38) 58.94,29.94 62.71,29.94 63.48,29.17 U8.22 ; U6.4 58.09,39.37 v1(58.09,39.37)
DMX_TX: length 21.4
  Top Layer w0.254: v1(59.12,31.11) 58.67,31.55 58.67,39.85 v1(58.09,40.44)
  Bottom Layer w0.254: v1(59.12,31.11) 59.57,30.65 64.14,30.65 64.75,30.04 U8.23 ; v1(58.09,40.44) 58.09,40.44 U6.5
DN: length 8.9
  Top Layer w0.254: v1(9.59,29.02) 9.58,29.01 9.25,29.01 8.99,28.75 4.47,28.75 4.32,28.6 4.32,27.86 4.44,27.74 5.66,27.74 5.67,27.75
  Bottom Layer w0.381: 10.76,29.02 10.81,28.97 ; 10.76,29.02 10.79,29.02 ; 10.76,29.02 v1(9.59,29.02)
DP: length 8.1
  Top Layer w0.254: 8.11,27.25 9.04,27.25 9.22,27.08 v1(9.58,27.08) ; 8.11,27.25 7.11,28.25 5.67,28.25 ; 8.11,27.25 5.67,27.25
  Bottom Layer w0.381: v1(9.58,27.08) 10.78,27.08 10.81,27.11
EN: length 120.1
  Top Layer w0.254: SW1.1 4.55,46.28 v1(13.21,46.28) 13.21,48.49 14.66,49.94 42.01,49.94 44.6,52.53 63.47,52.53 63.98,52.02 U9.2 63.96,50.22 v1(63.96,18.28)
  Bottom Layer w0.254: v1(63.96,18.28) 63.96,12.57 62.56,11.18 57.04,11.18 56.03,10.17 U8.3 ; v1(13.21,46.28) 13.18,46.31 R11.1 C9.2
ENCODER_A: length 52.7
  Bottom Layer w0.254: R40.1 C26.2 24.44,36.71 24.44,35.41 25.25,34.59 32.64,34.59 33.05,34.19 33.05,15.14 34.42,13.77 38.18,13.77 39.85,12.09 50.11,12.09 50.72,12.7 52.81,12.7 U8.5
ENCODER_B: length 58.7
  Bottom Layer w0.254: R43.1 C25.2 18.46,35.39 19.66,34.19 32.33,34.19 32.59,33.93 32.59,14.96 34.24,13.31 37.92,13.31 39.65,11.58 50.11,11.58 50.27,11.43 52.81,11.43 U8.4
ENCODER_KEY: length 48.7
  Bottom Layer w0.254: R42.2 C27.2 28.6,36.71 28.6,35.31 28.91,35 32.94,35 33.5,34.44 33.5,15.29 34.57,14.22 38.43,14.22 40,12.65 49.48,12.65 50.81,13.98 U8.6
IO0: length 41.9
  Top Layer w0.254: v1(70.32,26.21) 70.32,46.46 69.44,47.35 67.11,47.35 66.47,47.98 66.47,50.19 U9.1
  Bottom Layer w0.381: 66.49,50.22 66.49,49.06 66.14,48.72 59.26,48.72 57.34,46.8 R17.1 ; U8.27 70.32,26.21
KEY: length 4.9
  Bottom Layer w0.254: U14.3 25.65,43.13 26.58,42.2 R38.1 R42.1
LCD_A: length 16.8
  Bottom Layer w0.305: 43.45,35.81 43.45,35.71 39.98,35.71 39.29,35.03 39.29,27.38 40.43,26.25 43.39,26.25
LCD_BL: length 19.4
  Bottom Layer w0.305: U8.20 60.95,25.43 60.95,28.05 60.39,28.61 52.69,28.61 50.12,31.18 50.12,35.81
LCD_CS: length 15.8
  Bottom Layer w0.305: U11.5 50.46,28.25 51.79,26.93 56.79,26.93 57.13,26.59 57.13,25.42
LCD_RS: length 15.8
  Bottom Layer w0.305: U11.7 43.17,27.24 49.07,27.24 49.38,26.94 49.38,21.33 50.38,20.33 52.82,20.33
LCD_RST: length 15
  Bottom Layer w0.305: U8.12 50.93,21.6 49.89,22.64 49.89,27.45 49.58,27.75 U11.6
LCD_SCL: length 17.6
  Bottom Layer w0.305: U11.4 50.8,28.75 52.06,27.49 57.97,27.49 58.4,27.06 U8.18
LCD_SDA: length 18.7
  Bottom Layer w0.305: U8.19 59.67,27.07 58.69,28.05 52.37,28.05 50.67,29.75 43.75,29.75
LED2: length 45.3
  Top Layer w0.254: v1(82.35,11.12) 82.3,11.07 v1(66.54,11.07)
  Bottom Layer w0.254: U8.15 54.59,24.37 54.59,24.37 54.59,23.89 54.59,23.89 54.59,21 55.52,20.07 64.8,20.07 65.62,19.24 65.62,11.99 v1(66.54,11.07) ; R22.2 R49.2 83.23,10.27 82.37,11.12 v1(82.35,11.12)
LED3: length 43.9
  Top Layer w0.254: v1(71.65,19.05) 71.65,23.93 72.59,24.87 72.59,49 v1(72.62,49.02)
  Bottom Layer w0.254: v1(72.62,49.02) 74.17,49.02 75.74,47.45 84.11,47.45 R23.2
  Bottom Layer w0.381: v1(71.65,19.05) 70.33,19.05 U8.31
RXD0: length 45.5
  Top Layer w0.254: U9.3 61.47,50.22 v1(61.47,21.69)
  Bottom Layer w0.254: U8.36 67.92,12.71 67.22,13.4 67.22,20.91 66.45,21.69 v1(61.47,21.69)
RZ_CLK: length 10.1
  Bottom Layer w0.381: U8.32 72.07,17.79 72.67,18.39 72.67,23.55 73.2,24.07 U5.2
RZ_DATA: length 4.7
  Bottom Layer w0.381: U2.2 72.97,17.24 72.25,16.52 U8.33
RZ_OE: length 23
  Bottom Layer w0.254: 73.19,11.73 73.19,10.42 72.93,10.17 U8.38 ; 73.19,11.73 75.32,11.73 R5.1 ; 73.19,11.73 73.19,15.81 73.67,16.29 U2.1 74.79,16.31 75.56,16.31 75.82,16.56 75.82,18.64 75.56,18.9 74.32,18.9 73.33,19.89 73.33,22.86 73.59,23.12 U5.1
TXD0: length 47.9
  Top Layer w0.254: v1(60.78,20.88) 60.78,46.36 58.87,48.27 58.87,50.21 U9.4
  Bottom Layer w0.254: v1(60.78,20.88) 65.48,20.88 66.4,19.96 66.4,12.68 67.64,11.44 U8.37
USB_DET: length 97.9
  Top Layer w0.254: v1(68.84,15.24) 64.77,15.24 60.45,10.92 17.93,10.92 17.3,10.29 17.3,6.88 16.25,5.84 v1(7.8,5.84)
  Bottom Layer w0.254: R24.2 7.82,20.93 ; 7.82,20.93 R46.1 ; 7.82,20.93 7.82,19 1.6,19 0.91,18.31 0.91,7.01 2.09,5.84 v1(7.8,5.84) ; U8.34 70.33,15.24 v1(68.84,15.24)
USB_DN: length 86.1
  Top Layer w0.254: v1(51.57,22.86) 51.56,22.87 51.56,25.07 50.93,25.7 v1(39.88,25.7)
  Bottom Layer w0.254: v1(39.88,25.7) 38.91,26.67 38.91,49.05 38.18,49.78 15.24,49.78 14.61,49.15 14.61,42.34 13.2,40.93 D3.1 D3.6 13.2,34.91 13.89,34.21 13.89,29.28 13.59,28.97 R50.2
  Bottom Layer w0.381: v1(51.57,22.86) 52.81,22.86 U8.13
USB_DP: length 85
  Top Layer w0.254: v1(39.02,25.09) 50.44,25.09 50.88,24.66 v1(50.88,24.13)
  Bottom Layer w0.254: v1(39.02,25.09) 38.56,25.56 38.56,48.34 37.82,49.07 15.72,49.07 15.09,48.44 15.09,34.9 14.4,34.21 14.4,27.52 14,27.11 R51.1
  Bottom Layer w0.381: v1(50.88,24.13) 52.81,24.13 U8.14 ; 15.09,36.58 D3.4
VCHAR: length 41.1
  Bottom Layer w0.254: 12.29,16.66 12.24,16.61 9.37,16.61 9.03,16.27 R48.1 ; 29.52,16.87 29.52,14.79 29.11,14.38 13.97,14.38 13.92,14.33
  Bottom Layer w0.28: U16.7 12.75,13.16
  Bottom Layer w0.381: 12.75,13.16 13.92,14.33
  Bottom Layer w0.508: 13.92,14.33 13.92,15.04 12.29,16.66 12.29,20.78 12.7,21.18 C24.2 C23.1 ; C23.1 F1.1 ; C23.1 14.7,24.58 14.99,24.87 D2.2
$1N61: length 12.7
  Bottom Layer w0.381: 75.69,40.46 75.69,42.42 75.6,42.42 ; 75.69,40.46 75.72,40.49 77.48,40.49 R7.1 78.68,40.63 78.9,40.85 U7.2 82.07,40.85 83.13,41.9 CN1.3 ; 75.69,40.46 75.69,40.3 75.46,40.08 75.04,40.08 75.02,40.06 L1.3
$1N69: length 15
  Bottom Layer w0.381: 63.78,39.02 63.75,39.05 U4.2 ; 63.78,39.02 63.78,35.28 63.5,35 R3.1 ; 63.78,39.02 63.78,40.32 ; 63.78,40.32 U4.3 ; 63.78,40.32 63.78,43.38 63.56,43.6 U1.4
$1N71: length 12.5
  Bottom Layer w0.381: L1.4 75.34,39.28 75.61,39.01 75.61,38.63 ; CN1.2 83.27,36.82 81.74,38.36 U3.2 80.48,38.51 78.89,38.51 78.77,38.63 R7.2 75.61,38.63 ; 75.61,38.63 75.61,37.38 75.6,37.37 R4.1
$1N81: length 2.1
  Bottom Layer w0.381: 79.01,18.16 76.99,18.16 76.96,18.19
$1N82: length 2.1
  Bottom Layer w0.381: 76.96,25.02 79.01,25.02 79.01,25.02
$1N83: length 5.2
  Bottom Layer w0.381: 81.25,20.62 81.25,18.19 R1.1 ; 81.75,18.16 82.11,18.16 83.24,19.28 84.03,19.28
$1N88: length 2.7
  Bottom Layer w0.254: U6.1 59.62,37.95 59.77,37.8 61.89,37.8 U4.1
$1N92: length 3.1
  Bottom Layer w0.254: U6.8 59.62,41.89 59.78,42.05 60.12,42.05 60.58,41.59 U4.4
$1N94: length 6.4
  Bottom Layer w0.381: CN2.3 84.74,24.33 82.98,24.33 82.29,25.02 R8.1 81.25,24.99 D1.1
$1N98: length 2.4
  Bottom Layer w0.381: 69.33,38.76 68.5,38.76 68.22,39.05 U4.7
$1N99: length 2.5
  Bottom Layer w0.381: R9.2 68.49,40.75 68.05,40.32 U4.6
$1N105: length 3.3
  Bottom Layer w0.381: 4.77,39.11 8.01,39.11 R12.1
$1N108: length 2.1
  Bottom Layer w0.381: L1.1 72.53,39.28 72.11,38.86 71.43,38.86 71.33,38.76
$1N109: length 2.2
  Bottom Layer w0.381: R9.1 72.05,40.75 72.72,40.08 L1.2
$1N111: length 3.1
  Bottom Layer w0.381: LED2.1 88.26,6.81 R22.1
$1N113: length 6.5
  Bottom Layer w0.381: LED3.1 86.78,46.67 86.16,47.3 86.16,49.33 85.97,49.51 R23.1
$1N120: length 10
  Bottom Layer w0.381: U8.26 68.56,30.04 67.51,31.09 67.51,34.96 R20.2
$1N121: length 9.1
  Top Layer w0.381: v1(55.83,29.97) 55.84,29.96 v1(55.84,23.78)
  Bottom Layer w0.381: v1(55.84,23.78) 55.84,23.95 55.82,23.97 55.82,25.39 U8.16 ; v1(55.83,29.97) 55.83,31.17 55.87,31.21
$1N139: length 5.6
  Top Layer w0.254: v1(9.68,25.23) 9.68,25.83 9.26,26.25 6.02,26.25
  Bottom Layer w0.254: v1(9.68,25.23) 9.69,25.25 10.81,25.25
$1N140: length 5.8
  Top Layer w0.254: v1(9.6,30.84) 9.6,30.28 8.57,29.25 5.92,29.25
  Bottom Layer w0.254: v1(9.6,30.84) R13.1
$2N5: length 24
  Bottom Layer w0.381: Q3.3 42.6,47.14 42.6,50.34 42.04,50.9 25.32,50.9 24.79,51.44 24.79,53.85 U15.2
$2N7: length 1.8
  Bottom Layer w0.381: R44.2 44.64,46.15 44.62,46.17
$2N9: length 1.8
  Bottom Layer w0.381: Q3.1 46.35,48.07 R41.2
$2N53: length 3.9
  Bottom Layer w0.381: 45.45,35.81 45.52,35.88 Q2.3
$2N57: length 3.6
  Bottom Layer w0.381: R28.2 R25.1 46.49,37.64 46.47,37.67
$2N64: length 11.5
  Bottom Layer w0.381: R32.2 R31.1 ; U12.5 18.39,21.69 18.14,21.44 18.14,19.44 17.48,18.78 16.7,18.78
$2N65: length 3.5
  Bottom Layer w0.381: U12.6 23.03,22.64 22.58,23.09 L2.1
$2N66: length 7.7
  Bottom Layer w0.381: C16.2 28.01,24.82 Q1.3 28.01,21.1 27.65,20.74 U12.3 26.55,20.32 25.84,19.62 R29.2
$2N67: length 6.5
  Bottom Layer w0.508: D4.2 26.2,24.92 C21.1 26.26,24.86 26.26,23.77 26.55,23.49 U12.1
$2N70: length 17.6
  Top Layer w0.635: v1(18.29,17.06) v1(18.29,16.41) 7.68,16.41 3.84,12.57 SW2.2
$2N73: length 3.6
  Bottom Layer w0.254: R47.1 10.29,7.8 10.6,8.11 11.19,8.11 11.75,8.67 U16.4
$2N76: length 2.7
  Bottom Layer w0.254: U16.3 12.24,9.6 12.24,6.92
$2N77: length 10.7
  Top Layer w0.508: v1(14.51,8.87) 14.51,7.86 14.05,7.4 v1(8.82,7.4)
  Bottom Layer w0.28: v1(14.51,8.87) 13.49,8.87 13.25,9.11 U16.1
  Bottom Layer w0.508: 8.82,9.35 v1(8.82,7.4)
$2N79: length 60.8
  Top Layer w0.254: v1(46.56,20.07) 46.56,12.02 46.07,11.53 v1(22.02,11.53) 19.25,11.53 19,11.79 19,14.05 18.45,14.6 v1(12.81,14.6)
  Bottom Layer w0.254: v1(22.02,11.53) CN3.2 22.02,9.04 22.4,8.66 U21.1 ; v1(46.56,20.07) 46.58,20.09 R53.2 48.05,22.91 C30.2 ; v1(12.81,14.6) 12.25,14.6
  Bottom Layer w0.28: U16.6 12.25,14.98 11.94,15.29 R48.2
$2N87: length 7.7
  Bottom Layer w0.254: Q1.1 29.23,23.05 29.01,22.83 29.01,21.21 27.47,19.68 R26.1 R27.2
$2N101: length 3.8
  Bottom Layer w0.254: 14.19,6.92 14.19,8.01 13.93,8.26 12.99,8.26 12.76,8.49 12.76,9.6 U16.2

## Copper pours and planes (outline as drawn; the poured copper is in the pictures)
+5V on Bottom Layer: 15.21,28.96 19.68,28.96 19.68,32.7 25.76,32.7 25.76,30.61 25.76,30.53 21.9,30.53 21.9,29.01 22.86,29.01 22.86,27.48 15.21,27.48
GND on Top Layer: 0,56.01 93.02,56.01 93.02,0 0,0
GND on Bottom Layer: 0,56.01 93.07,56.01 93.07,0 0,0
VBAT on Bottom Layer: 7.06,13.97 11.96,13.97 11.96,11.63 7.06,11.63
VBAT on Bottom Layer: 14.24,13.06 14.98,13.06 14.98,11.18 21.14,11.18 21.14,9.55 14.24,9.55
VBUS on Top Layer: 5.94,25.09 5.94,30.94 8.79,30.94 8.79,29.92 8.78,29.91 8.76,29.92 7.33,29.92 7.33,26.21 8.78,26.21 8.78,25.09
VBUS on Bottom Layer: 6.71,30.89 8.99,30.89 8.99,23.95 10.52,23.95 10.52,22.2 6.71,22.2
$2N70 on Bottom Layer: 24.42,21.08 24.42,16.51 18.85,16.51 18.85,16.03 15.86,16.03 15.86,17.78 18.69,17.78 18.69,21.08

## Text on the board
Bottom Silkscreen Layer: C | D | GND | B | A | RDM/DMX | RZ_CODE
Top Silkscreen Layer: 3V3 | GND | TX0 | RX0 | EN | IO0 | + N - | RESET | PWR | RDM/DMX | RZ_CODE | ESP-DMX-RDM-RZ / PixelBridge v1.4 | F111 Studio
